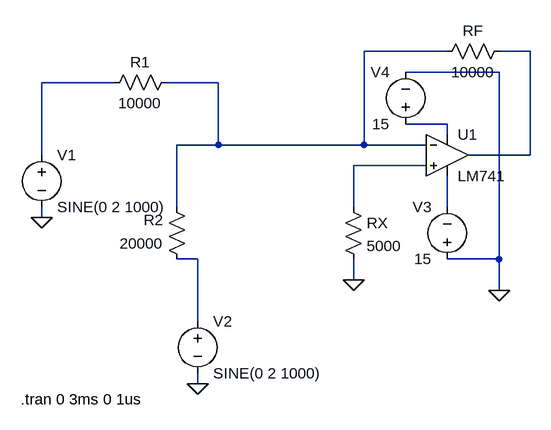
[diagram p0: schematic adder.asc]
adder.asc, the LTspice schematic file:
Version 4.1
SHEET 1 880 680
WIRE 560 -80 432 -80
WIRE 688 -80 640 -80
WIRE 640 -48 496 -48
WIRE 48 -32 -64 -32
WIRE 208 -32 128 -32
WIRE 560 32 496 32
WIRE 560 48 560 32
WIRE 208 64 208 -32
WIRE 208 64 144 64
WIRE 432 64 432 -80
WIRE 432 64 208 64
WIRE 528 64 432 64
WIRE -64 80 -64 -32
WIRE 688 80 688 -80
WIRE 688 80 592 80
WIRE 528 96 416 96
WIRE 144 160 144 64
WIRE 416 160 416 96
WIRE 560 160 560 112
WIRE -64 176 -64 160
WIRE 176 240 144 240
WIRE 640 240 640 -48
WIRE 640 240 560 240
WIRE 416 272 416 240
WIRE 640 288 640 240
WIRE 176 336 176 240
WIRE 176 432 176 416
FLAG -64 176 0
FLAG 176 432 0
FLAG 416 272 0
FLAG 640 288 0
SYMBOL voltage -64 64 R0
WINDOW 123 0 0 Left 0
WINDOW 39 0 0 Left 0
SYMATTR InstName V1
SYMATTR Value SINE(0 2 1000)
SYMBOL voltage 176 320 R0
WINDOW 123 0 0 Left 0
WINDOW 39 0 0 Left 0
SYMATTR InstName V2
SYMATTR Value SINE(0 2 1000)
SYMBOL res 144 -48 R90
WINDOW 0 0 56 VBottom 2
WINDOW 3 32 56 VTop 2
SYMATTR InstName R1
SYMATTR Value 10000
SYMBOL res 160 256 R180
WINDOW 0 36 76 Left 2
WINDOW 3 36 40 Left 2
SYMATTR InstName R2
SYMATTR Value 20000
SYMBOL res 544 -64 R270
WINDOW 0 32 56 VTop 2
WINDOW 3 0 56 VBottom 2
SYMATTR InstName RF
SYMATTR Value 10000
SYMBOL res 400 144 R0
SYMATTR InstName RX
SYMATTR Value 5000
SYMBOL LM741 560 16 R0
SYMATTR InstName U1
SYMBOL voltage 496 48 R180
WINDOW 0 24 96 Left 2
WINDOW 3 24 16 Left 2
SYMATTR InstName V4
SYMATTR Value 15
SYMBOL voltage 560 256 R180
WINDOW 0 24 96 Left 2
WINDOW 3 24 16 Left 2
WINDOW 123 0 0 Left 0
WINDOW 39 0 0 Left 0
SYMATTR InstName V3
SYMATTR Value 15
TEXT -96 456 Left 2 !.tran 0 3ms 0 1us

The netlist it stands for:
* adder.asc
V1 N003 0 SINE(0 2 1000)
V2 N007 0 SINE(0 2 1000)
R1 N001 N003 10000
R2 N007 N001 20000
RF N001 N002 10000
RX N005 0 5000
X§U1 N005 N001 N004 N006 N002 LM741  ; pins In+ In- V+ V- OUT
V4 N004 0 15
V3 0 N006 15
.tran 0 3ms 0 1us
.lib LM741.lib
.backanno
.end